# Altium schematic sheet CORE_ABC.SchDoc: Explorer STM32F407 Board
size A4; Author: ATOM@ALIENTEK; Revision: V3.4; SheetSize: A4
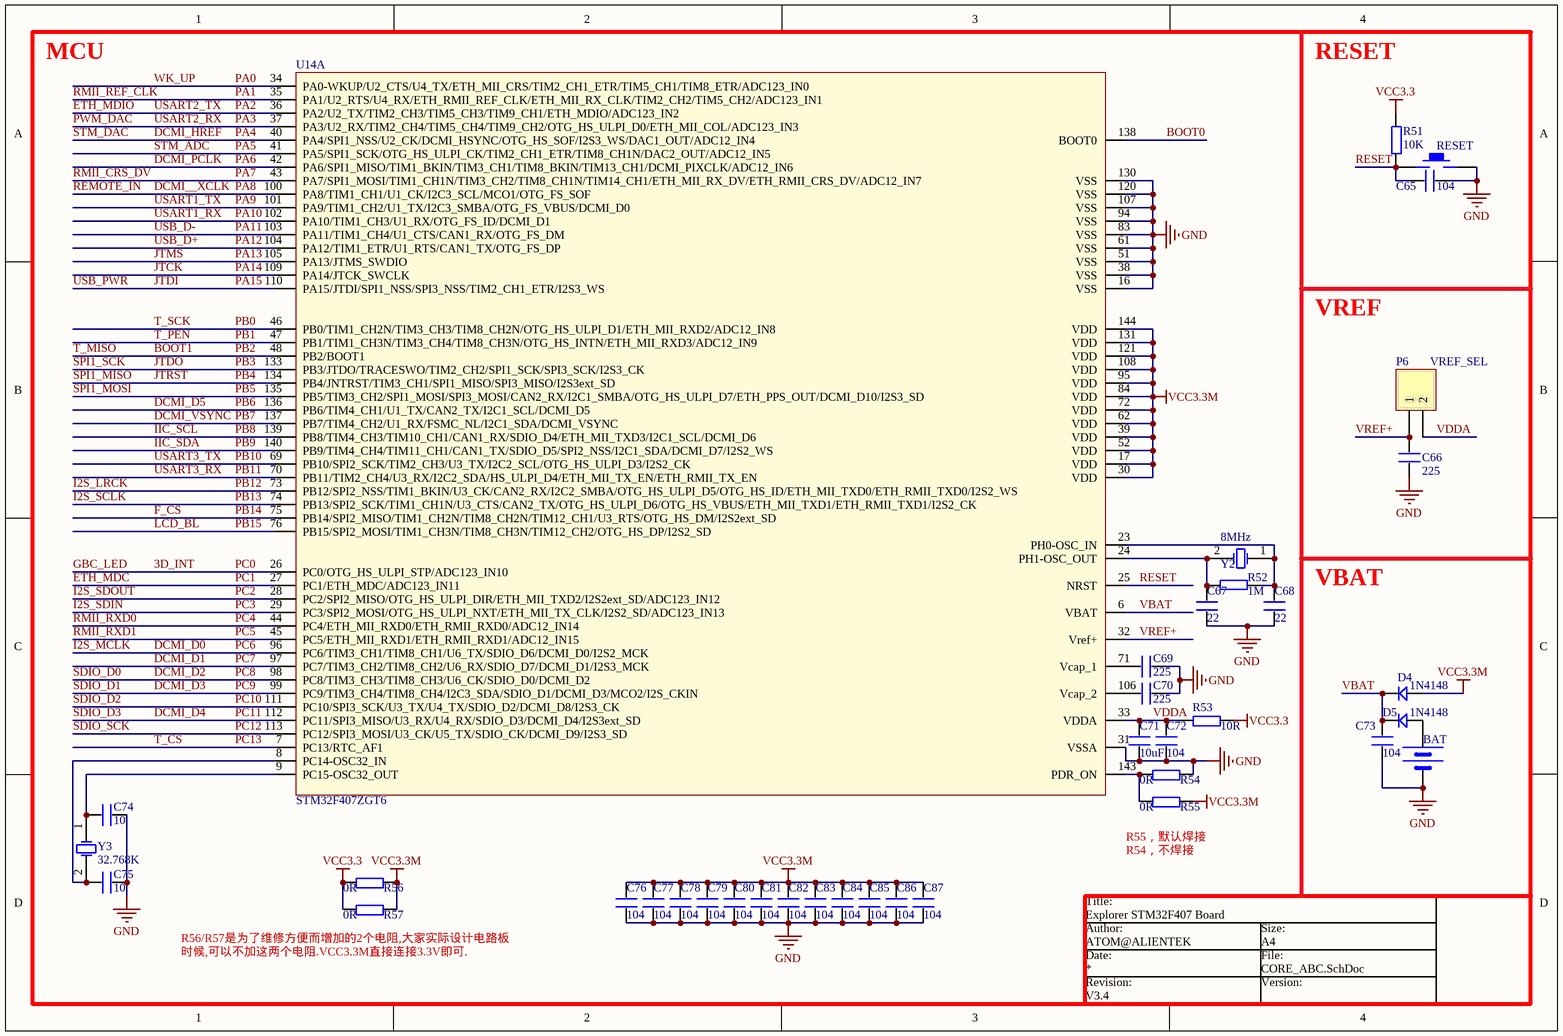
[diagram p0: CORE_ABC.SchDoc]

## Parts
BAT  BATT  [BATM]  (value not drawn)
C65  104  [0402]
C66  225  [0402]
C67  22  [0402]
C68  22  [0402]
C69  225  [0402]
C70  225  [0402]
C71  10uF  [0603P]
C72  104  [0402]
C73  104  [0402]
C74  10  [0402]
C75  10  [0402]
C76  104  [0402]
C77  104  [0402]
C78  104  [0402]
C79  104  [0402]
C80  104  [0402]
C81  104  [0402]
C82  104  [0402]
C83  104  [0402]
C84  104  [0402]
C85  104  [0402]
C86  104  [0402]
C87  104  [0402]
D4  1N4148  [DIODE_SOP]
D5  1N4148  [DIODE_SOP]
P6  VREF_SEL  [HDR1X2]
R51  10K  [0402]
R52  1M  [0402]
R53  10R  [0402]
R54  0R  [0402]
R55  0R  [0402]
R56  0R  [0402]
R57  0R  [0402]
RESET  KEY_M  [KEY_M]  (value not drawn)
U14  STM32F407ZGT6  [LQFP144]  (part A of 2)
Y2  8MHz  [XTAL_US]
Y3  32.768K  [XTAL32]

## Nets
GND: BAT.2(GND) C65.1 C66.1 C67.1 C68.1 C69.2 C70.2 C71.1 C72.1 C73.2 C74.1 C75.1 C76.1 C77.1 C78.1 C79.1 C80.1 C81.1 C82.1 C83.1 C84.1 C85.1 C86.1 C87.1 R54.2 RESET.2 U14.16(VSS) U14.31(VSSA) U14.38(VSS) U14.51(VSS) U14.61(VSS) U14.83(VSS) U14.94(VSS) U14.107(VSS) U14.120(VSS) U14.130(VSS)
VCC3.3: R51.2 R53.2 R56.1 R57.1
VCC3.3M: C76.2 C77.2 C78.2 C79.2 C80.2 C81.2 C82.2 C83.2 C84.2 C85.2 C86.2 C87.2 D4.1 R55.2 R56.2 R57.2 U14.17(VDD) U14.30(VDD) U14.39(VDD) U14.52(VDD) U14.62(VDD) U14.72(VDD) U14.84(VDD) U14.95(VDD) U14.108(VDD) U14.121(VDD) U14.131(VDD) U14.144(VDD)
3D_INT: U14.26(PC0/OTG_HS_ULPI_STP/ADC123_IN10)  [also labelled GBC_LED, PC0]
BOOT0: U14.138(BOOT0)
BOOT1: U14.48(PB2/BOOT1)  [also labelled PB2, T_MISO]
DCMI__XCLK: U14.100(PA8/TIM1_CH1/U1_CK/I2C3_SCL/MCO1/OTG_FS_SOF)  [also labelled PA8, REMOTE_IN]
DCMI_D0: U14.96(PC6/TIM3_CH1/TIM8_CH1/U6_TX/SDIO_D6/DCMI_D0/I2S2_MCK)  [also labelled I2S_MCLK, PC6]
DCMI_D1: U14.97(PC7/TIM3_CH2/TIM8_CH2/U6_RX/SDIO_D7/DCMI_D1/I2S3_MCK)  [also labelled PC7]
DCMI_D2: U14.98(PC8/TIM3_CH3/TIM8_CH3/U6_CK/SDIO_D0/DCMI_D2)  [also labelled PC8, SDIO_D0]
DCMI_D3: U14.99(PC9/TIM3_CH4/TIM8_CH4/I2C3_SDA/SDIO_D1/DCMI_D3/MCO2/I2S_CKIN)  [also labelled PC9, SDIO_D1]
DCMI_D4: U14.112(PC11/SPI3_MISO/U3_RX/U4_RX/SDIO_D3/DCMI_D4/I2S3ext_SD)  [also labelled PC11, SDIO_D3]
DCMI_D5: U14.136(PB6/TIM4_CH1/U1_TX/CAN2_TX/I2C1_SCL/DCMI_D5)  [also labelled PB6]
DCMI_HREF: U14.40(PA4/SPI1_NSS/U2_CK/DCMI_HSYNC/OTG_HS_SOF/I2S3_WS/DAC1_OUT/ADC12_IN4)  [also labelled PA4, STM_DAC]
DCMI_PCLK: U14.42(PA6/SPI1_MISO/TIM1_BKIN/TIM3_CH1/TIM8_BKIN/TIM13_CH1/DCMI_PIXCLK/ADC12_IN6)  [also labelled PA6]
DCMI_VSYNC: U14.137(PB7/TIM4_CH2/U1_RX/FSMC_NL/I2C1_SDA/DCMI_VSYNC)  [also labelled PB7]
ETH_MDC: U14.27(PC1/ETH_MDC/ADC123_IN11)  [also labelled PC1]
ETH_MDIO: U14.36(PA2/U2_TX/TIM2_CH3/TIM5_CH3/TIM9_CH1/ETH_MDIO/ADC123_IN2)  [also labelled PA2, USART2_TX]
F_CS: U14.75(PB14/SPI2_MISO/TIM1_CH2N/TIM8_CH2N/TIM12_CH1/U3_RTS/OTG_HS_DM/I2S2ext_SD)  [also labelled PB14]
I2S_LRCK: U14.73(PB12/SPI2_NSS/TIM1_BKIN/U3_CK/CAN2_RX/I2C2_SMBA/OTG_HS_ULPI_D5/OTG_HS_ID/ETH_MII_TXD0/ETH_RMII_TXD0/I2S2_WS)  [also labelled PB12]
I2S_SCLK: U14.74(PB13/SPI2_SCK/TIM1_CH1N/U3_CTS/CAN2_TX/OTG_HS_ULPI_D6/OTG_HS_VBUS/ETH_MII_TXD1/ETH_RMII_TXD1/I2S2_CK)  [also labelled PB13]
I2S_SDIN: U14.29(PC3/SPI2_MOSI/OTG_HS_ULPI_NXT/ETH_MII_TX_CLK/I2S2_SD/ADC123_IN13)  [also labelled PC3]
I2S_SDOUT: U14.28(PC2/SPI2_MISO/OTG_HS_ULPI_DIR/ETH_MII_TXD2/I2S2ext_SD/ADC123_IN12)  [also labelled PC2]
IIC_SCL: U14.139(PB8/TIM4_CH3/TIM10_CH1/CAN1_RX/SDIO_D4/ETH_MII_TXD3/I2C1_SCL/DCMI_D6)  [also labelled PB8]
IIC_SDA: U14.140(PB9/TIM4_CH4/TIM11_CH1/CAN1_TX/SDIO_D5/SPI2_NSS/I2C1_SDA/DCMI_D7/I2S2_WS)  [also labelled PB9]
JTCK: U14.109(PA14/JTCK_SWCLK)  [also labelled PA14]
JTDI: U14.110(PA15/JTDI/SPI1_NSS/SPI3_NSS/TIM2_CH1_ETR/I2S3_WS)  [also labelled PA15, USB_PWR]
JTDO: U14.133(PB3/JTDO/TRACESWO/TIM2_CH2/SPI1_SCK/SPI3_SCK/I2S3_CK)  [also labelled PB3, SPI1_SCK]
JTMS: U14.105(PA13/JTMS_SWDIO)  [also labelled PA13]
JTRST: U14.134(PB4/JNTRST/TIM3_CH1/SPI1_MISO/SPI3_MISO/I2S3ext_SD)  [also labelled PB4, SPI1_MISO]
LCD_BL: U14.76(PB15/SPI2_MOSI/TIM1_CH3N/TIM8_CH3N/TIM12_CH2/OTG_HS_DP/I2S2_SD)  [also labelled PB15]
PA0: U14.34(PA0-WKUP/U2_CTS/U4_TX/ETH_MII_CRS/TIM2_CH1_ETR/TIM5_CH1/TIM8_ETR/ADC123_IN0)  [also labelled WK_UP]
PA1: U14.35(PA1/U2_RTS/U4_RX/ETH_RMII_REF_CLK/ETH_MII_RX_CLK/TIM2_CH2/TIM5_CH2/ADC123_IN1)  [also labelled RMII_REF_CLK]
PA3: U14.37(PA3/U2_RX/TIM2_CH4/TIM5_CH4/TIM9_CH2/OTG_HS_ULPI_D0/ETH_MII_COL/ADC123_IN3)  [also labelled PWM_DAC, USART2_RX]
PA5: U14.41(PA5/SPI1_SCK/OTG_HS_ULPI_CK/TIM2_CH1_ETR/TIM8_CH1N/DAC2_OUT/ADC12_IN5)  [also labelled STM_ADC]
PA7: U14.43(PA7/SPI1_MOSI/TIM1_CH1N/TIM3_CH2/TIM8_CH1N/TIM14_CH1/ETH_MII_RX_DV/ETH_RMII_CRS_DV/ADC12_IN7)  [also labelled RMII_CRS_DV]
PA9: U14.101(PA9/TIM1_CH2/U1_TX/I2C3_SMBA/OTG_FS_VBUS/DCMI_D0)  [also labelled USART1_TX]
PA10: U14.102(PA10/TIM1_CH3/U1_RX/OTG_FS_ID/DCMI_D1)  [also labelled USART1_RX]
PA11: U14.103(PA11/TIM1_CH4/U1_CTS/CAN1_RX/OTG_FS_DM)  [also labelled USB_D-]
PA12: U14.104(PA12/TIM1_ETR/U1_RTS/CAN1_TX/OTG_FS_DP)  [also labelled USB_D+]
PB0: U14.46(PB0/TIM1_CH2N/TIM3_CH3/TIM8_CH2N/OTG_HS_ULPI_D1/ETH_MII_RXD2/ADC12_IN8)  [also labelled T_SCK]
PB1: U14.47(PB1/TIM1_CH3N/TIM3_CH4/TIM8_CH3N/OTG_HS_INTN/ETH_MII_RXD3/ADC12_IN9)  [also labelled T_PEN]
PB5: U14.135(PB5/TIM3_CH2/SPI1_MOSI/SPI3_MOSI/CAN2_RX/I2C1_SMBA/OTG_HS_ULPI_D7/ETH_PPS_OUT/DCMI_D10/I2S3_SD)  [also labelled SPI1_MOSI]
PB10: U14.69(PB10/SPI2_SCK/TIM2_CH3/U3_TX/I2C2_SCL/OTG_HS_ULPI_D3/I2S2_CK)  [also labelled USART3_TX]
PB11: U14.70(PB11/TIM2_CH4/U3_RX/I2C2_SDA/HS_ULPI_D4/ETH_MII_TX_EN/ETH_RMII_TX_EN)  [also labelled USART3_RX]
PC4: U14.44(PC4/ETH_MII_RXD0/ETH_RMII_RXD0/ADC12_IN14)  [also labelled RMII_RXD0]
PC5: U14.45(PC5/ETH_MII_RXD1/ETH_RMII_RXD1/ADC12_IN15)  [also labelled RMII_RXD1]
PC10: U14.111(PC10/SPI3_SCK/U3_TX/U4_TX/SDIO_D2/DCMI_D8/I2S3_CK)  [also labelled SDIO_D2]
PC12: U14.113(PC12/SPI3_MOSI/U3_CK/U5_TX/SDIO_CK/DCMI_D9/I2S3_SD)  [also labelled SDIO_SCK]
PC13: U14.7(PC13/RTC_AF1)  [also labelled T_CS]
RESET: C65.2 R51.1 RESET.1 U14.25(NRST)
VBAT: C73.1 D4.2 D5.2 U14.6(VBAT)
VDDA: C71.2 C72.2 P6.2 R53.1 U14.33(VDDA)
VREF+: C66.2 P6.1 U14.32(Vref+)
NetBAT_1: BAT.1(VCC) D5.1
NetC67_2: C67.2 R52.2 U14.24(PH1-OSC_OUT) Y2.2(OSC2)
NetC68_2: C68.2 R52.1 U14.23(PH0-OSC_IN) Y2.1(OSC1)
NetC69_1: C69.1 U14.71(Vcap_1)
NetC70_1: C70.1 U14.106(Vcap_2)
NetC74_2: C74.2 U14.9(PC15-OSC32_OUT) Y3.1(OSC1)
NetC75_2: C75.2 U14.8(PC14-OSC32_IN) Y3.2(OSC2)
NetR54_1: R54.1 R55.1 U14.143(PDR_ON)

## Notes on the sheet
- MCU
- RESET
- VREF
- (near C68) VBAT
- (near R55) R55，默认焊接
  R54，不焊接
- (near R57) R56/R57是为了维修方便而增加的2个电阻,大家实际设计电路板
  时候,可以不加这两个电阻.VCC3.3M直接连接3.3V即可.
- Title:
- Author:
- Date:
- Revision:
- Size:
- File:
- Version:

## Library data of the parts
BAT = BAT
C65-C87 = C
D4 D5 = D
P6 = Header 2: Header, 2-Pin; LatestRevisionDate: 17-Jul-2002; LatestRevisionNote: Re-released for DXP Platform.; Publisher: Altium Limited
R51-R57 = R
U14 = STM32F407ZET6
Y2 Y3 = XTAL: Crystal Oscillator; Published: 8-Jun-2000; LatestRevisionDate: 17-Jul-2002; LatestRevisionNote: Re-released for DXP Platform.; Publisher: Altium Limited